# Altium schematic sheet [7] Mini_HDMI.SchDoc
size B; Organization: Altium Limited; Address1: L3, 12a Rodborough Rd; Address2: Frenchs Forest; Address3: NSW; Address4: Australia 2086
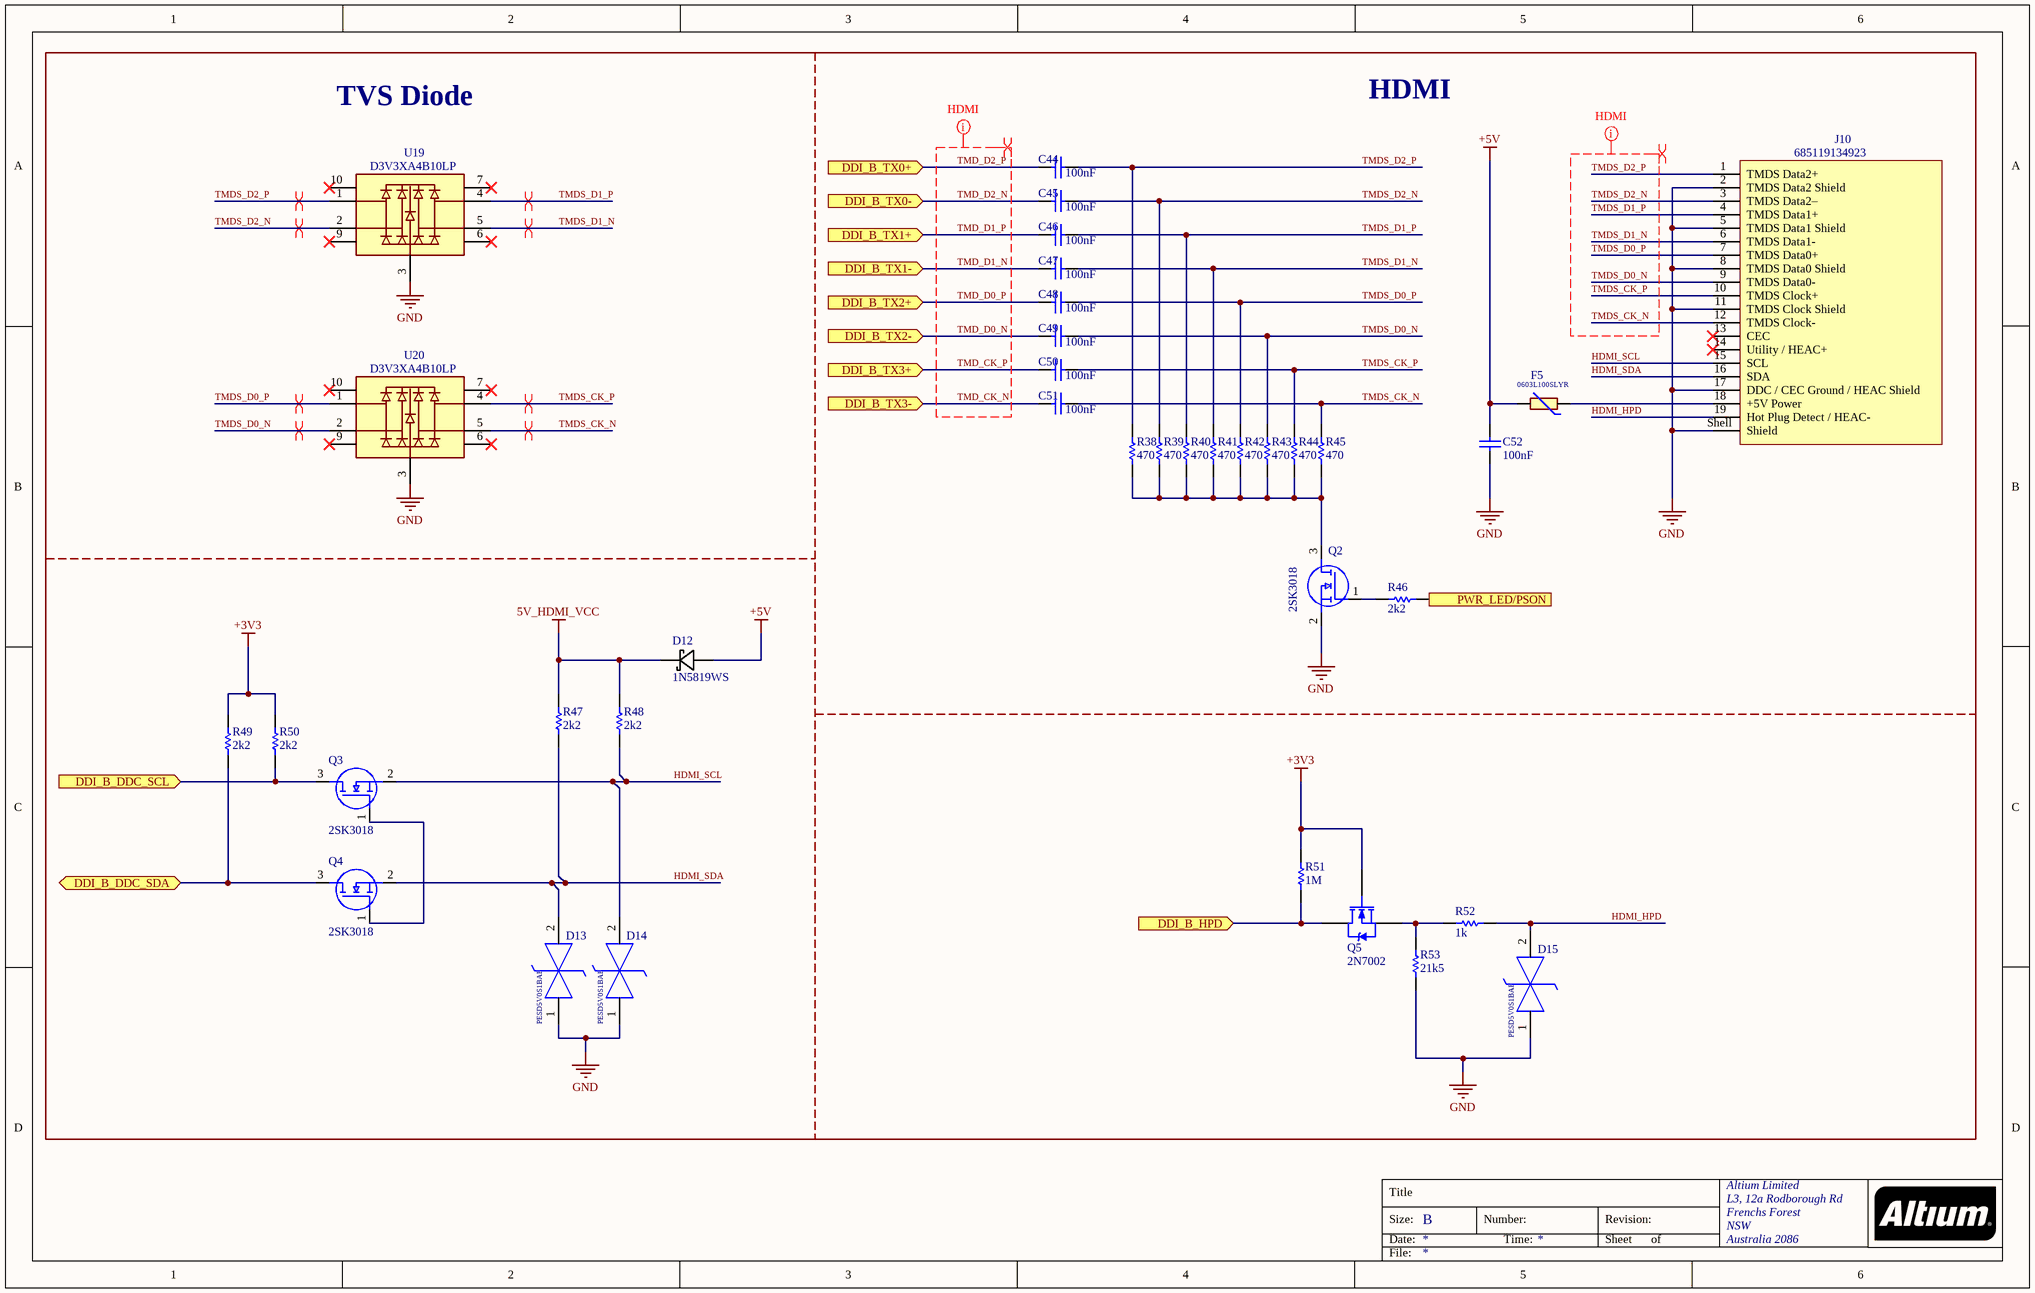
[diagram p0: [7] Mini_HDMI.SchDoc]

## Parts
C44  100nF  [Capacitor 0402]
C45  100nF  [Capacitor 0402]
C46  100nF  [Capacitor 0402]
C47  100nF  [Capacitor 0402]
C48  100nF  [Capacitor 0402]
C49  100nF  [Capacitor 0402]
C50  100nF  [Capacitor 0402]
C51  100nF  [Capacitor 0402]
C52  100nF  [Capacitor 0402]
D12  1N5819WS  [SOD-323_MCC]
D13  PESD5V0S1BAF  [SOD2512X110N]
D14  PESD5V0S1BAF  [SOD2512X110N]
D15  PESD5V0S1BAF  [SOD2512X110N]
F5  0603L100SLYR  [FUSC1608X100N]
J10  685119134923  [685119134923]
Q2  2SK3018  [SOT96P240X120-3N]
Q3  2SK3018  [SOT96P240X120-3N]
Q4  2SK3018  [SOT96P240X120-3N]
Q5  2N7002  [SOT23127P600-8N]
R38  470  [Resistencia 0402]
R39  470  [Resistencia 0402]
R40  470  [Resistencia 0402]
R41  470  [Resistencia 0402]
R42  470  [Resistencia 0402]
R43  470  [Resistencia 0402]
R44  470  [Resistencia 0402]
R45  470  [Resistencia 0402]
R46  2k2  [Resistencia 0402]
R47  2k2  [Resistencia 0402]
R48  2k2  [Resistencia 0402]
R49  2k2  [Resistencia 0402]
R50  2k2  [Resistencia 0402]
R51  1M  [Resistencia 0402]
R52  1k  [Resistencia 0402]
R53  21k5  [Resistencia 0402]
U19  D3V3XA4B10LP  [ESDLC0524DFN10TP]
U20  D3V3XA4B10LP  [ESDLC0524DFN10TP]

## Ports
DDI_B_DDC_SCL (in), DDI_B_DDC_SDA (bidir), DDI_B_HPD (in), DDI_B_TX0+ (in), DDI_B_TX0- (in), DDI_B_TX1+ (in), DDI_B_TX1- (in), DDI_B_TX2+ (in), DDI_B_TX2- (in), DDI_B_TX3+ (in), DDI_B_TX3- (in), PWR_LED/PSON (out)

## Nets
5V_HDMI_VCC: D12.1 R47.1(A) R48.1(A)
+3V3: Q5.1(G) R49.1(A) R50.1(A) R51.1(A)
+5V: C52.2 D12.2 F5.2
GND: C52.1 D13.1(K1) D14.1(K1) D15.1(K1) J10.2(TMDS_Data2_Shield) J10.5(TMDS_Data1_Shield) J10.8(TMDS_Data0_Shield) J10.11(TMDS_Clock_Shield) J10.17(DDC_/_CEC_Ground_/_HEAC_Shield) J10.Shell(Shield) Q2.2(S) R53.2(B) U19.3(VSS) U20.3(VSS)
DDI_B_DDC_SCL: Q3.3(D) R50.2(B) ; port DDI_B_DDC_SCL
DDI_B_DDC_SDA: Q4.3(D) R49.2(B) ; port DDI_B_DDC_SDA
DDI_B_HPD: Q5.3(D) R51.2(B) ; port DDI_B_HPD
HDMI_HPD: D15.2(K2) J10.19(Hot_Plug_Detect_/_HEAC-) R52.2(B)
HDMI_SCL: D14.2(K2) J10.15(SCL) Q3.2(S) R48.2(B)
HDMI_SDA: D13.2(K2) J10.16(SDA) Q4.2(S) R47.2(B)
PWR_LED/PSON: R46.1(A) ; port PWR_LED/PSON
TMD_CK_N: C51.2 ; port DDI_B_TX3-
TMD_CK_P: C50.2 ; port DDI_B_TX3+
TMD_D0_N: C49.2 ; port DDI_B_TX2-
TMD_D0_P: C48.2 ; port DDI_B_TX2+
TMD_D1_N: C47.2 ; port DDI_B_TX1-
TMD_D1_P: C46.2 ; port DDI_B_TX1+
TMD_D2_N: C45.2 ; port DDI_B_TX0-
TMD_D2_P: C44.2 ; port DDI_B_TX0+
TMDS_CK_N: C51.1 J10.12(TMDS_Clock-) R45.2(B) U20.5(I/O)
TMDS_CK_P: C50.1 J10.10(TMDS_Clock+) R44.2(B) U20.4(I/O)
TMDS_D0_N: C49.1 J10.9(TMDS_Data0-) R43.2(B) U20.2(I/O)
TMDS_D0_P: C48.1 J10.7(TMDS_Data0+) R42.2(B) U20.1(I/O)
TMDS_D1_N: C47.1 J10.6(TMDS_Data1-) R41.2(B) U19.5(I/O)
TMDS_D1_P: C46.1 J10.4(TMDS_Data1+) R40.2(B) U19.4(I/O)
TMDS_D2_N: C45.1 J10.3(TMDS_Data2–) R39.2(B) U19.2(I/O)
TMDS_D2_P: C44.1 J10.1(TMDS_Data2+) R38.2(B) U19.1(I/O)
NetF5_1: F5.1 J10.18(+5V_Power)
NetQ2_1: Q2.1(G) R46.2(B)
NetQ2_3: Q2.3(D) R38.1(A) R39.1(A) R40.1(A) R41.1(A) R42.1(A) R43.1(A) R44.1(A) R45.1(A)
NetQ3_1: Q3.1(G) Q4.1(G)
NetQ5_2: Q5.2(S) R52.1(A) R53.1(A)

Not connected (* = marked no-connect by the designer): J10 13(CEC)* 14(Utility_/_HEAC+)*; U19 6(NC)* 7(NC)* 9(NC)* 10(NC)*; U20 6(NC)* 7(NC)* 9(NC)* 10(NC)*

## Layout directives
mark named HDMI: TMD_CK_N, TMD_CK_P, TMD_D0_N, TMD_D0_P, TMD_D1_N, TMD_D1_P, TMD_D2_N, TMD_D2_P, TMDS_CK_N, TMDS_CK_P, TMDS_D0_N, TMDS_D0_P, TMDS_D1_N, TMDS_D1_P, TMDS_D2_N, TMDS_D2_P
differential pair; differential pair class 100_OHM_DIFF: TMD_CK_N, TMD_CK_P, TMD_D0_N, TMD_D0_P, TMD_D1_N, TMD_D1_P, TMD_D2_N, TMD_D2_P, TMDS_CK_N, TMDS_CK_P, TMDS_D0_N, TMDS_D0_P, TMDS_D1_N, TMDS_D1_P, TMDS_D2_N, TMDS_D2_P

## Notes on the sheet
- HDMI
- TVS Diode
- Title
- Size:
- Date:
- B
- Number:
- Time:
- Revision:
- Sheet
- of
- File:

## Library data of the parts
C44-C52 = Capacitor 0402: Capacitor Ceramico SMD 0402
D12 = 1N5819WS: Diodos 40 V 1A Montaje en superficie SOD-323; Manufacturer_Name: MCC; Manufacturer_Part_Number: SD103AWS-TP; Copyright: Copyright (C) 2025 Ultra Librarian. All rights reserved.
D13-D15 = PESD5V0S1BAF: ESD Suppressors / TVS Diodes PESD5V0S1BA/SOD323/SOD2; Manufacturer_Name: Nexperia; Geometry.Height: 1.1mm; Mouser Part Number: 771-PESD5V0S1BAF; Mouser Price/Stock: https://www.mouser.co.uk/ProductDetail/Nexperia/PESD5V0S1BAF?qs=45Avz0nZxhtk8Fj2r0tKWQ%3D%3D; Manufacturer_Part_Number: PESD5V0S1BAF; Datasheet Link: https://assets.nexperia.com/documents/data-sheet/PESD5V0S1BA.pdf
F5 = 0603L100SLYR: Fuse, Resettable, 603L Series, Polymeric, Surface Mount, 6V, 1A | Littelfuse 0603L100SLYR; SnapEDA_Link: https://www.snapeda.com/parts/0603L100SLYR/Littelfuse/view-part/?ref=snap; Package: Package; Value: *; MF: Littelfuse; MP: 0603L100SLYR; Check_prices: https://www.snapeda.com/parts/0603L100SLYR/Littelfuse/view-part/?ref=eda
J10 = 685119134923: WR-COM HDMI SMT Horizontal, Receptacle, Type A; Manufacturer: Wurth Elektronik; Match Code: WR-HDMI; Connector Type: Type A; Contact Resistance: 30mOhm; Rated Current: 0.5A; Working Voltage: 40VAC; Manufacturer Part Number: 685119134923; Category: Input/Output Connectors; ComponentLink1Description: Website Link; ComponentLink1URL: https://www.we-online.com/redexpert/article/685119134923?ad; ComponentLink2Description: Datasheet Link; ComponentLink2URL: https://www.we-online.com/redexpert/spec/685119134923?ad; Mount: Surface Mount; Operating Temperature Max: 85°C; Operating Temperature Min: -25°C; Packaging: Tape and Reel; Gender: Receptacle; Number of Pins: 19; Orientation: Horizontal
Q2-Q4 = 2SK3018: Canal N Montaje en superficie 30 V 100mA 200mW SOT-23; Manufacturer_Name: onsemi; Manufacturer_Part_Number: 2N7002; Geometry.Height: 1.2mm; Mouser Part Number: 512-2N7002; Mouser Price/Stock: https://www.mouser.co.uk/ProductDetail/onsemi-Fairchild/2N7002?qs=0dwsXDNhqlz66WJJhrTFjQ%3D%3D; Datasheet Link: https://www.onsemi.com/pub/Collateral/NDS7002A-D.PDF
Q5 = 2N7002: Mosfet N SOT23
R38-R53 = Resistencia SMD 0402
U19 U20 = D3V3XA4B10LP: 9.4V (típico) Abrazadera 4 A (8/20µs) Ipp TVS - Diodos Montaje en superficie U-DFN2510-10